# Altium schematic sheet 7.mechanical_hw.SchDoc
size A4; Organization: Electronic and Telecommunication Department - University of Moratuwa; Address1: Bandaranayake Mawatha; Address2: Moratuwa; Address3: Sri Lanka; Address4: 10400; DocumentNumber: 8; SheetNumber: 8; SheetTotal: 8; Page: Mechanical
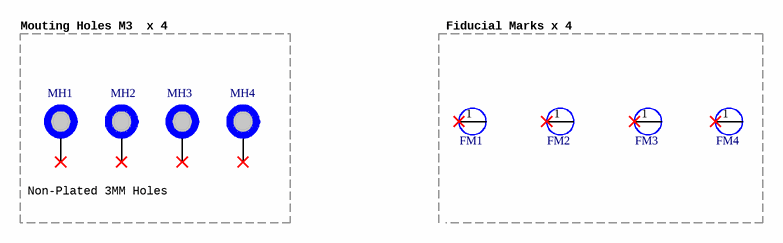
[diagram p0: 7.mechanical_hw.SchDoc]

## Parts
FM1  FM  [FM]  (value not drawn)
FM2  FM  [FM]  (value not drawn)
FM3  FM  [FM]  (value not drawn)
FM4  FM  [FM]  (value not drawn)
MH1  MH_7.4MMC_3.2MMD  [MECHANICAL_M3_NON_PLATED]  (value not drawn)  (no BOM)
MH2  MH_7.4MMC_3.2MMD  [MECHANICAL_M3_NON_PLATED]  (value not drawn)  (no BOM)
MH3  MH_7.4MMC_3.2MMD  [MECHANICAL_M3_NON_PLATED]  (value not drawn)  (no BOM)
MH4  MH_7.4MMC_3.2MMD  [MECHANICAL_M3_NON_PLATED]  (value not drawn)  (no BOM)

## Blocks framed on the sheet
Mouting Holes M3  x 4: MH1-MH4

## Nets

Not connected (* = marked no-connect by the designer): FM1 1(FM)*; FM2 1(FM)*; FM3 1(FM)*; FM4 1(FM)*; MH1 1*; MH2 1*; MH3 1*; MH4 1*

## Notes on the sheet
- Fiducial Marks x 4
- Non-Plated 3MM Holes
- Title :
- Size:
- Date:
- Page :
- A4
- Number:
- Time:
- Revision:
- Sheet
- of
- Sheet Name :
- Drawn By :

## Library data of the parts
FM1-FM4 = FM: Fiducial mark; Value: *; Parameter 1: *
MH1-MH4 = Mounting_Hole2: Mounting Hole 7.4mm Diameter, 3.2mm Drill